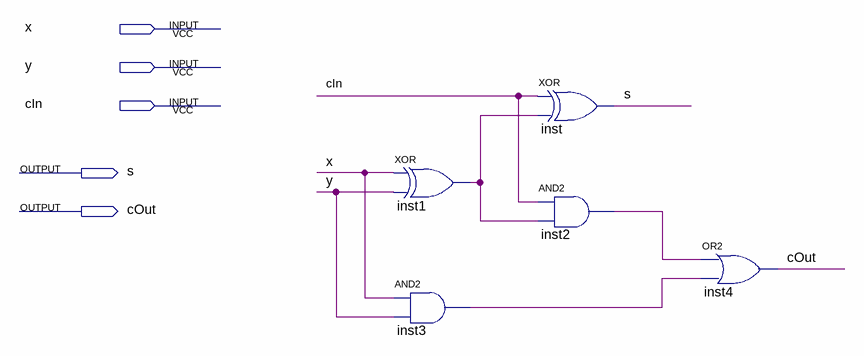
[diagram p0: schematic sheet]
// Quartus schematic aula05.bdf as structural Verilog: 5 symbols, 5 pins
module aula05 (
  input  x,
  input  y,
  input  cIn,
  output s,
  output cOut
);

  wire inst1_out, inst2_out, inst3_out;

  xor inst1 (inst1_out, x, y);
  and inst3 (inst3_out, x, y);
  xor inst (s, cIn, inst1_out);
  and inst2 (inst2_out, cIn, inst1_out);
  or inst4 (cOut, inst2_out, inst3_out);
endmodule
